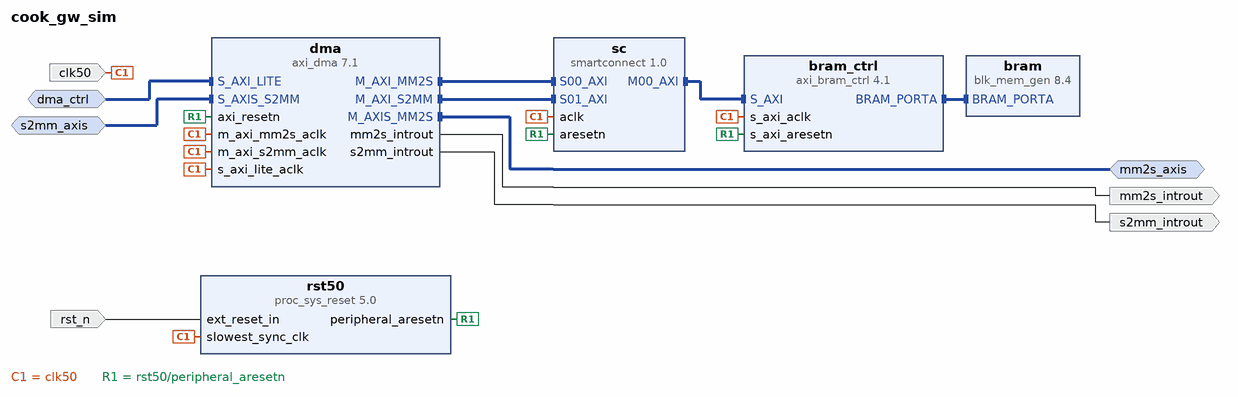
[diagram p0: block diagram of the top level]
# Vivado block design cook_gw_sim, xc7a100tcsg324-1, Vivado 2025.2
create_bd_design cook_gw_sim

create_bd_intf_port -mode Slave -vlnv xilinx.com:interface:aximm_rtl:1.0 dma_ctrl
set_property -dict [list \
  CONFIG.ADDR_WIDTH 16 \
  CONFIG.ARUSER_WIDTH 0 \
  CONFIG.AWUSER_WIDTH 0 \
  CONFIG.BUSER_WIDTH 0 \
  CONFIG.DATA_WIDTH 32 \
  CONFIG.FREQ_HZ 50000000 \
  CONFIG.HAS_BRESP 1 \
  CONFIG.HAS_BURST 0 \
  CONFIG.HAS_CACHE 0 \
  CONFIG.HAS_LOCK 0 \
  CONFIG.HAS_PROT 0 \
  CONFIG.HAS_QOS 0 \
  CONFIG.HAS_REGION 0 \
  CONFIG.HAS_RRESP 1 \
  CONFIG.HAS_WSTRB 0 \
  CONFIG.ID_WIDTH 0 \
  CONFIG.NUM_READ_OUTSTANDING 1 \
  CONFIG.NUM_READ_THREADS 1 \
  CONFIG.NUM_WRITE_OUTSTANDING 1 \
  CONFIG.NUM_WRITE_THREADS 1 \
  CONFIG.PROTOCOL AXI4LITE \
  CONFIG.READ_WRITE_MODE READ_WRITE \
  CONFIG.RUSER_BITS_PER_BYTE 0 \
  CONFIG.RUSER_WIDTH 0 \
  CONFIG.WUSER_BITS_PER_BYTE 0 \
  CONFIG.WUSER_WIDTH 0 \
] [get_bd_intf_ports dma_ctrl]
create_bd_intf_port -mode Master -vlnv xilinx.com:interface:axis_rtl:1.0 mm2s_axis
set_property -dict {CONFIG.FREQ_HZ 50000000} [get_bd_intf_ports mm2s_axis]
create_bd_intf_port -mode Slave -vlnv xilinx.com:interface:axis_rtl:1.0 s2mm_axis
set_property -dict [list \
  CONFIG.FREQ_HZ 50000000 \
  CONFIG.HAS_TKEEP 1 \
  CONFIG.HAS_TLAST 1 \
  CONFIG.HAS_TREADY 1 \
  CONFIG.HAS_TSTRB 0 \
  CONFIG.LAYERED_METADATA undef \
  CONFIG.TDATA_NUM_BYTES 4 \
  CONFIG.TDEST_WIDTH 0 \
  CONFIG.TID_WIDTH 0 \
  CONFIG.TUSER_WIDTH 0 \
] [get_bd_intf_ports s2mm_axis]
create_bd_port -dir I -type clk clk50
set_property -dict [list \
  CONFIG.ASSOCIATED_BUSIF dma_ctrl:mm2s_axis:s2mm_axis \
  CONFIG.ASSOCIATED_RESET rst_n \
  CONFIG.FREQ_HZ 50000000 \
] [get_bd_ports clk50]
create_bd_port -dir I -type rst rst_n
set_property -dict {CONFIG.POLARITY ACTIVE_LOW} [get_bd_ports rst_n]
create_bd_port -dir O -type intr mm2s_introut
create_bd_port -dir O -type intr s2mm_introut

create_bd_cell -type ip -vlnv xilinx.com:ip:axi_dma:7.1 dma
set_property -dict [list \
  CONFIG.c_addr_width 32 \
  CONFIG.c_include_mm2s 1 \
  CONFIG.c_include_s2mm 1 \
  CONFIG.c_include_sg 0 \
  CONFIG.c_m_axi_mm2s_data_width 32 \
  CONFIG.c_m_axi_s2mm_data_width 32 \
  CONFIG.c_m_axis_mm2s_tdata_width 32 \
  CONFIG.c_mm2s_burst_size 16 \
  CONFIG.c_s2mm_burst_size 16 \
  CONFIG.c_s_axis_s2mm_tdata_width 32 \
  CONFIG.c_sg_length_width 16 \
] [get_bd_cells dma]
create_bd_cell -type ip -vlnv xilinx.com:ip:smartconnect:1.0 sc
set_property -dict {CONFIG.NUM_MI 1 CONFIG.NUM_SI 2} [get_bd_cells sc]
create_bd_cell -type ip -vlnv xilinx.com:ip:proc_sys_reset:5.0 rst50
create_bd_cell -type ip -vlnv xilinx.com:ip:axi_bram_ctrl:4.1 bram_ctrl
set_property -dict {CONFIG.DATA_WIDTH 32 CONFIG.SINGLE_PORT_BRAM 1} [get_bd_cells bram_ctrl]
create_bd_cell -type ip -vlnv xilinx.com:ip:blk_mem_gen:8.4 bram
set_property -dict {CONFIG.Memory_Type Single_Port_RAM} [get_bd_cells bram]

# ---- connections ----

connect_bd_intf_net [get_bd_intf_pins bram_ctrl/BRAM_PORTA] [get_bd_intf_pins bram/BRAM_PORTA]
connect_bd_intf_net [get_bd_intf_ports mm2s_axis] [get_bd_intf_pins dma/M_AXIS_MM2S]
connect_bd_intf_net [get_bd_intf_pins dma/M_AXI_MM2S] [get_bd_intf_pins sc/S00_AXI]
connect_bd_intf_net [get_bd_intf_pins dma/M_AXI_S2MM] [get_bd_intf_pins sc/S01_AXI]
connect_bd_intf_net [get_bd_intf_ports dma_ctrl] [get_bd_intf_pins dma/S_AXI_LITE]
connect_bd_intf_net [get_bd_intf_ports s2mm_axis] [get_bd_intf_pins dma/S_AXIS_S2MM]
connect_bd_intf_net [get_bd_intf_pins sc/M00_AXI] [get_bd_intf_pins bram_ctrl/S_AXI]
connect_bd_net -net clk50_1 [get_bd_ports clk50] \
  [get_bd_pins dma/s_axi_lite_aclk] [get_bd_pins dma/m_axi_mm2s_aclk] [get_bd_pins dma/m_axi_s2mm_aclk] [get_bd_pins sc/aclk] \
  [get_bd_pins rst50/slowest_sync_clk] [get_bd_pins bram_ctrl/s_axi_aclk]
connect_bd_net [get_bd_pins dma/mm2s_introut] [get_bd_ports mm2s_introut]
connect_bd_net [get_bd_pins dma/s2mm_introut] [get_bd_ports s2mm_introut]
connect_bd_net [get_bd_pins rst50/peripheral_aresetn] [get_bd_pins dma/axi_resetn] [get_bd_pins sc/aresetn] [get_bd_pins bram_ctrl/s_axi_aresetn]
connect_bd_net [get_bd_ports rst_n] [get_bd_pins rst50/ext_reset_in]

# ---- address map ----
assign_bd_address -offset 0x00000000 -range 8K -target_address_space [get_bd_addr_spaces dma/Data_MM2S] [get_bd_addr_segs bram_ctrl/S_AXI/Mem0]
assign_bd_address -offset 0x00000000 -range 8K -target_address_space [get_bd_addr_spaces dma/Data_S2MM] [get_bd_addr_segs bram_ctrl/S_AXI/Mem0]
assign_bd_address -offset 0x0000 -range 64K -target_address_space [get_bd_addr_spaces dma_ctrl] [get_bd_addr_segs dma/S_AXI_LITE/Reg]

validate_bd_design
save_bd_design
